# Altium project STM32_Dev_Board.PrjPcb
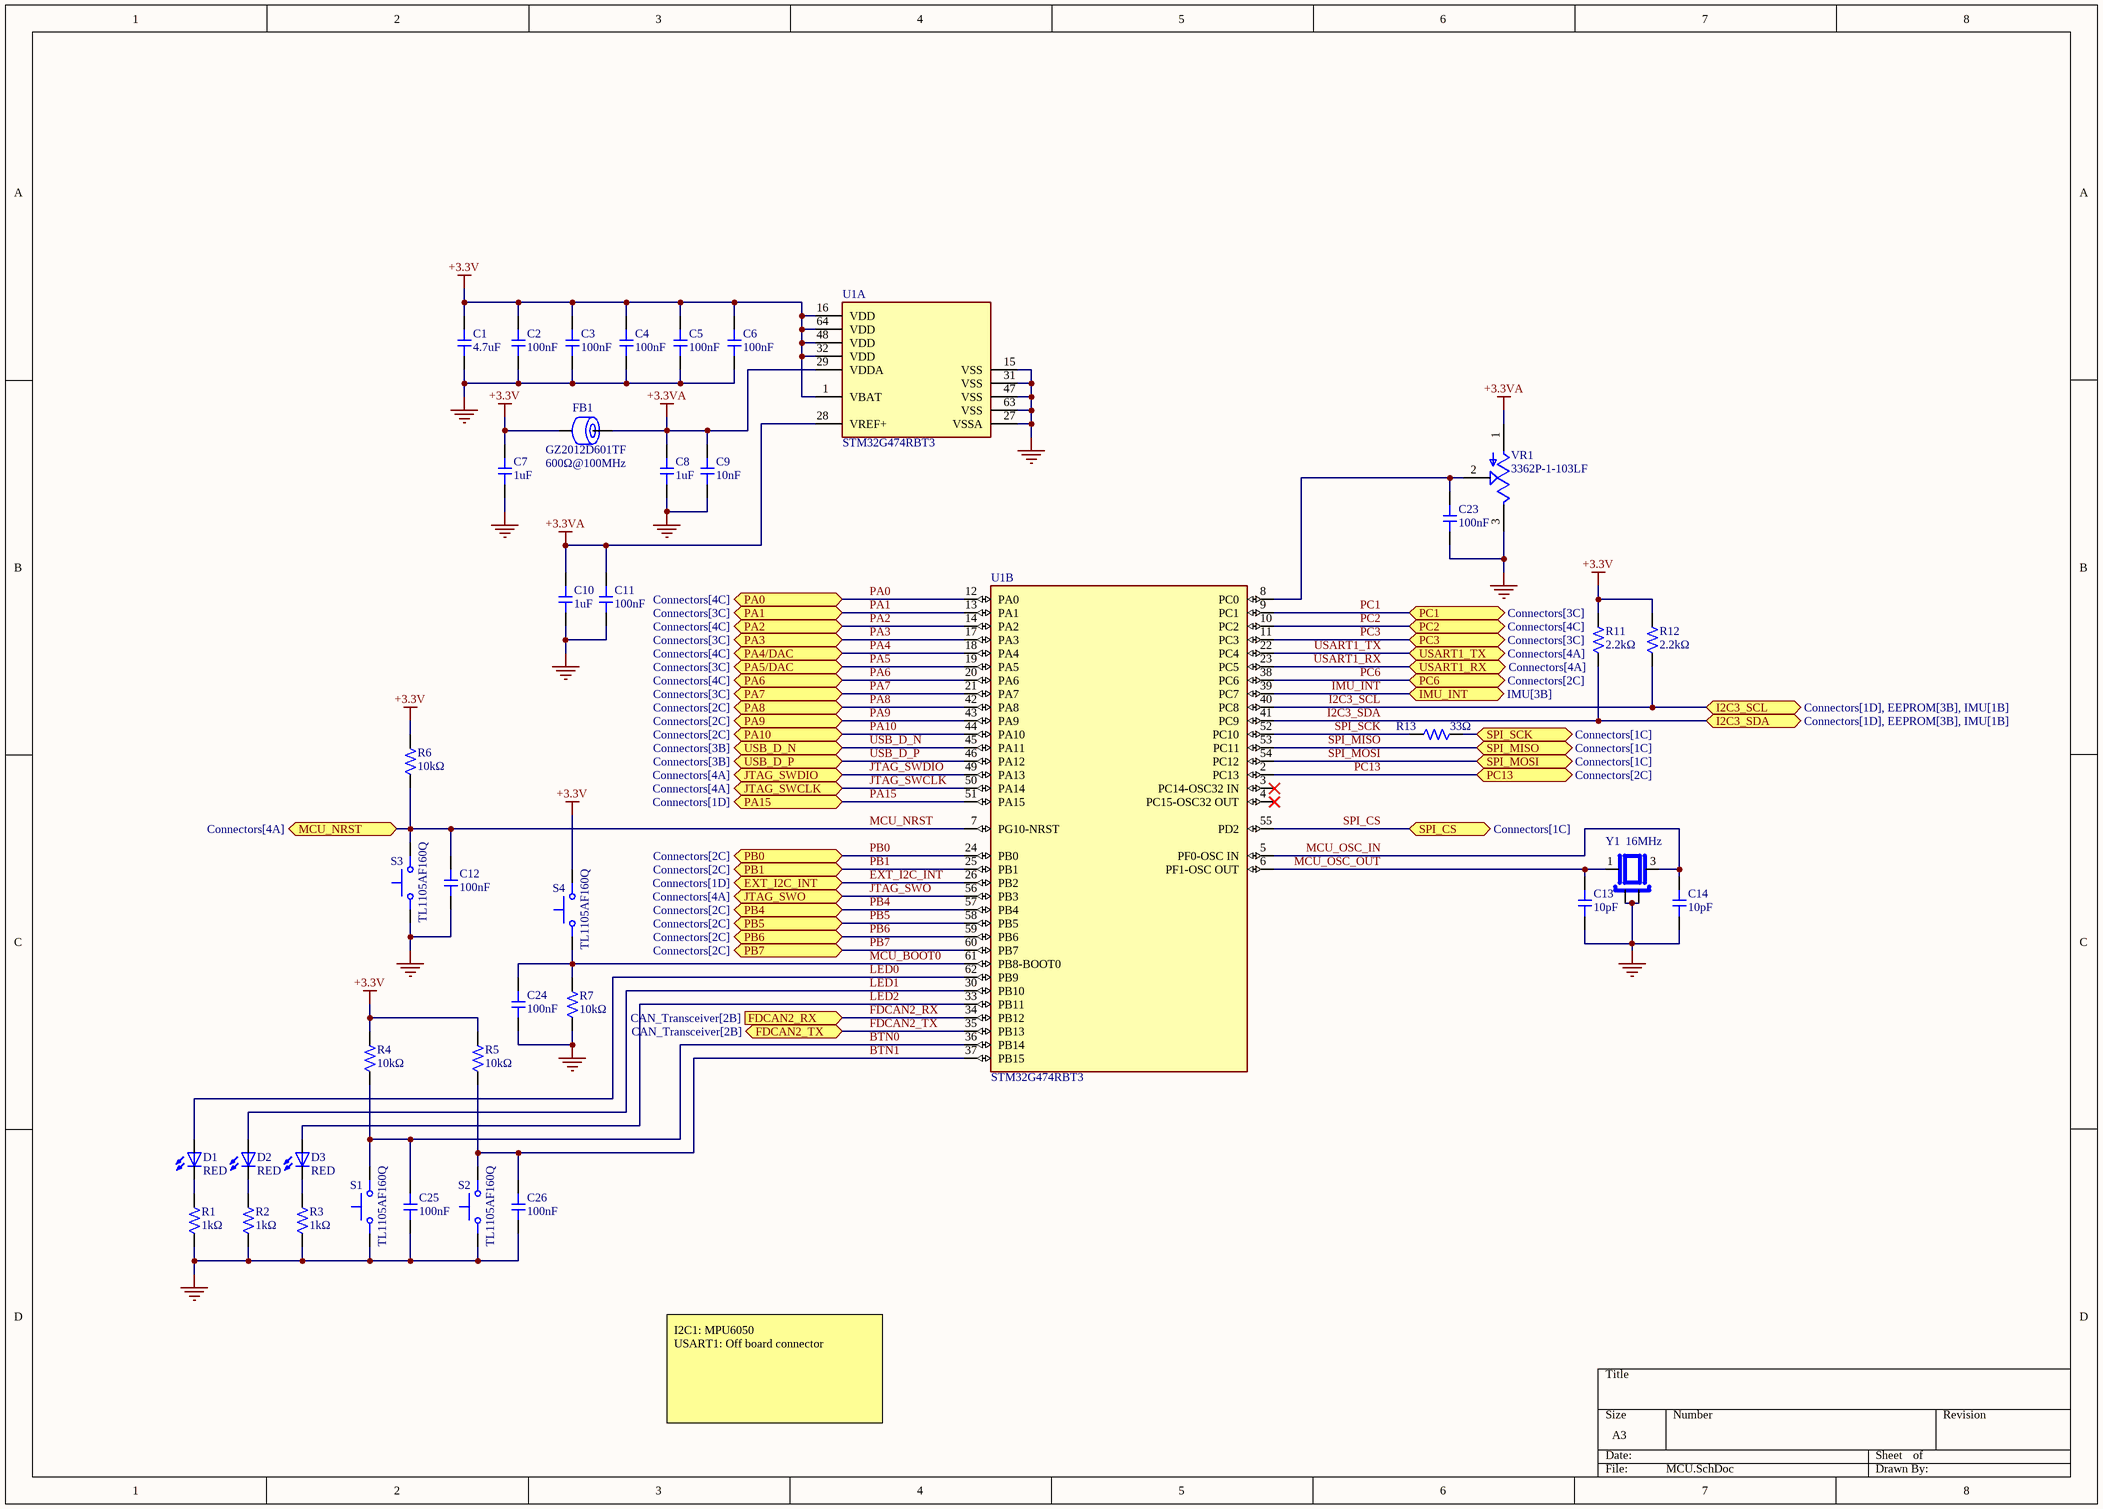
[diagram p0: MCU.SchDoc]
6 sheets, 70 parts. Net scope: flat (ports and power ports of the same name join across sheets).
Board file: STM32_Dev_Board.PcbDoc
Sheets:
  MCU.SchDoc
  Power.SchDoc
  Connectors.SchDoc
  IMU.SchDoc
  CAN_Transceiver.SchDoc
  EEPROM.SchDoc

## Sheet MCU.SchDoc
size A3; SheetNumber: 1; SheetTotal: 6

### Parts
C1  Capacitance: 4.7uF  [CAP-0402]  (hidden comment: CL05A475MP5NRNC)
C2  Capacitance: 100nF  [CAP-0402]  (hidden comment: CL05B104KO5NNNC)
C3  Capacitance: 100nF  [CAP-0402]  (hidden comment: CL05B104KO5NNNC)
C4  Capacitance: 100nF  [CAP-0402]  (hidden comment: CL05B104KO5NNNC)
C5  Capacitance: 100nF  [CAP-0402]  (hidden comment: CL05B104KO5NNNC)
C6  Capacitance: 100nF  [CAP-0402]  (hidden comment: CL05B104KO5NNNC)
C7  Capacitance: 1uF  [CAP-0402]  (hidden comment: CL05A105KA5NQNC)
C8  Capacitance: 1uF  [CAP-0402]  (hidden comment: CL05A105KA5NQNC)
C9  Capacitance: 10nF  [CAP-0402]  (hidden comment: CL05B103KB5NNNC)
C10  Capacitance: 1uF  [CAP-0402]  (hidden comment: CL05A105KA5NQNC)
C11  Capacitance: 100nF  [CAP-0402]  (hidden comment: CL05B104KO5NNNC)
C12  Capacitance: 100nF  [CAP-0402]  (hidden comment: CL05B104KO5NNNC)
C13  Capacitance: 10pF  [CAP-0402]  (hidden comment: CL05C100JB5NNNC)
C14  Capacitance: 10pF  [CAP-0402]  (hidden comment: CL05C100JB5NNNC)
C23  Capacitance: 100nF  [CAP-0402]  (hidden comment: CL05B104KO5NNNC)
C24  Capacitance: 100nF  [CAP-0402]  (hidden comment: CL05B104KO5NNNC)
C25  Capacitance: 100nF  [CAP-0402]  (hidden comment: CL05B104KO5NNNC)
C26  Capacitance: 100nF  [CAP-0402]  (hidden comment: CL05B104KO5NNNC)
D1  RED  [LED-0402]
D2  RED  [LED-0402]
D3  RED  [LED-0402]
FB1  GZ2012D601TF  Impedance @ Frequency: 600Ω@100MHz  [FB-0805]
R1  Resistance: 1kΩ  [RES-0402]  (hidden comment: 0402WGF1001TCE)
R2  Resistance: 1kΩ  [RES-0402]  (hidden comment: 0402WGF1001TCE)
R3  Resistance: 1kΩ  [RES-0402]  (hidden comment: 0402WGF1001TCE)
R4  Resistance: 10kΩ  [RES-0402]  (hidden comment: 0402WGF1002TCE)
R5  Resistance: 10kΩ  [RES-0402]  (hidden comment: 0402WGF1002TCE)
R6  Resistance: 10kΩ  [RES-0402]  (hidden comment: 0402WGF1002TCE)
R7  Resistance: 10kΩ  [RES-0402]  (hidden comment: 0402WGF1002TCE)
R11  Resistance: 2.2kΩ  [RES-0402]  (hidden comment: 0402WGF2201TCE)
R12  Resistance: 2.2kΩ  [RES-0402]  (hidden comment: 0402WGF2201TCE)
R13  Resistance: 33Ω  [RES-0402]  (hidden comment: 0402WGF330JTCE)
S1  TL1105AF160Q  [TL1105AF160Q]
S2  TL1105AF160Q  [TL1105AF160Q]
S3  TL1105AF160Q  [TL1105AF160Q]
S4  TL1105AF160Q  [TL1105AF160Q]
U1  STM32G474RBT3  [FP-LQFP64-5W-MFG]  (parts A,B of 2)
VR1  3362P-1-103LF  [TRIM_3362P-1-103LF]
Y1  16MHz  [OSC_X322516MLB4SI]

### Ports
EXT_I2C_INT (bidir, see Connectors[1D]), FDCAN2_RX (in, see CAN_Transceiver[2B]), FDCAN2_TX (bidir, see CAN_Transceiver[2B]), I2C3_SCL (bidir, see Connectors[1D], EEPROM[3B], IMU[1B]), I2C3_SDA (bidir, see Connectors[1D], EEPROM[3B], IMU[1B]), IMU_INT (bidir, see IMU[3B]), JTAG_SWCLK (bidir, see Connectors[4A]), JTAG_SWDIO (bidir, see Connectors[4A]), JTAG_SWO (bidir, see Connectors[4A]), MCU_NRST (bidir, see Connectors[4A]), PA0 (bidir, see Connectors[4C]), PA1 (bidir, see Connectors[3C]), PA2 (bidir, see Connectors[4C]), PA3 (bidir, see Connectors[3C]), PA4/DAC (bidir, see Connectors[4C]), PA5/DAC (bidir, see Connectors[3C]), PA6 (bidir, see Connectors[4C]), PA7 (bidir, see Connectors[3C]), PA8 (bidir, see Connectors[2C]), PA9 (bidir, see Connectors[2C]), PA10 (bidir, see Connectors[2C]), PA15 (bidir, see Connectors[1D]), PB0 (bidir, see Connectors[2C]), PB1 (bidir, see Connectors[2C]), PB4 (bidir, see Connectors[2C]), PB5 (bidir, see Connectors[2C]), PB6 (bidir, see Connectors[2C]), PB7 (bidir, see Connectors[2C]), PC1 (bidir, see Connectors[3C]), PC2 (bidir, see Connectors[4C]), PC3 (bidir, see Connectors[3C]), PC6 (bidir, see Connectors[2C]), PC13 (bidir, see Connectors[2C]), SPI_CS (bidir, see Connectors[1C]), SPI_MISO (bidir, see Connectors[1C]), SPI_MOSI (bidir, see Connectors[1C]), SPI_SCK (bidir, see Connectors[1C]), USART1_RX (bidir, see Connectors[4A]), USART1_TX (bidir, see Connectors[4A]), USB_D_N (bidir, see Connectors[3B]), USB_D_P (bidir, see Connectors[3B])

### Nets
+3.3V: C1.2 C2.2 C3.2 C4.2 C5.2 C6.2 C7.2 FB1.1 R4.2 R5.2 R6.2 R11.2 R12.2 S4.3 U1.1(VBAT) U1.16(VDD) U1.32(VDD) U1.48(VDD) U1.64(VDD)
+3.3VA: C8.2 C9.2 C10.2 C11.2 FB1.2 U1.28(VREF+) U1.29(VDDA) VR1.1(CCW)
GND: C1.1 C2.1 C3.1 C4.1 C5.1 C6.1 C7.1 C8.1 C9.1 C10.1 C11.1 C12.1 C13.1 C14.1 C23.1 C24.1 C25.1 C26.1 R1.1 R2.1 R3.1 R7.1 S1.1 S2.1 S3.1 U1.15(VSS) U1.27(VSSA) U1.31(VSS) U1.47(VSS) U1.63(VSS) VR1.3(CW) Y1.2(GND) Y1.4(GND)
BTN0: C25.2 R4.1 S1.3 U1.36(PB14)
BTN1: C26.2 R5.1 S2.3 U1.37(PB15)
EXT_I2C_INT: U1.26(PB2) ; port EXT_I2C_INT
FDCAN2_RX: U1.34(PB12) ; port FDCAN2_RX
FDCAN2_TX: U1.35(PB13) ; port FDCAN2_TX
I2C3_SCL: R12.1 U1.40(PC8) ; port I2C3_SCL
I2C3_SDA: R11.1 U1.41(PC9) ; port I2C3_SDA
IMU_INT: U1.39(PC7) ; port IMU_INT
JTAG_SWCLK: U1.50(PA14) ; port JTAG_SWCLK
JTAG_SWDIO: U1.49(PA13) ; port JTAG_SWDIO
JTAG_SWO: U1.56(PB3) ; port JTAG_SWO
LED0: D1.2(POS) U1.62(PB9)
LED1: D2.2(POS) U1.30(PB10)
LED2: D3.2(POS) U1.33(PB11)
MCU_BOOT0: C24.2 R7.2 S4.1 U1.61(PB8-BOOT0)
MCU_NRST: C12.2 R6.1 S3.3 U1.7(PG10-NRST) ; port MCU_NRST
MCU_OSC_IN: C14.2 U1.5(PF0-OSC_IN) Y1.3
MCU_OSC_OUT: C13.2 U1.6(PF1-OSC_OUT) Y1.1
PA0: U1.12(PA0) ; port PA0
PA1: U1.13(PA1) ; port PA1
PA2: U1.14(PA2) ; port PA2
PA3: U1.17(PA3) ; port PA3
PA4: U1.18(PA4) ; port PA4/DAC
PA5: U1.19(PA5) ; port PA5/DAC
PA6: U1.20(PA6) ; port PA6
PA7: U1.21(PA7) ; port PA7
PA8: U1.42(PA8) ; port PA8
PA9: U1.43(PA9) ; port PA9
PA10: U1.44(PA10) ; port PA10
PA15: U1.51(PA15) ; port PA15
PB0: U1.24(PB0) ; port PB0
PB1: U1.25(PB1) ; port PB1
PB4: U1.57(PB4) ; port PB4
PB5: U1.58(PB5) ; port PB5
PB6: U1.59(PB6) ; port PB6
PB7: U1.60(PB7) ; port PB7
PC1: U1.9(PC1) ; port PC1
PC2: U1.10(PC2) ; port PC2
PC3: U1.11(PC3) ; port PC3
PC6: U1.38(PC6) ; port PC6
PC13: U1.2(PC13) ; port PC13
SPI_CS: U1.55(PD2) ; port SPI_CS
SPI_MISO: U1.53(PC11) ; port SPI_MISO
SPI_MOSI: U1.54(PC12) ; port SPI_MOSI
SPI_SCK: R13.1 U1.52(PC10)
USART1_RX: U1.23(PC5) ; port USART1_RX
USART1_TX: U1.22(PC4) ; port USART1_TX
USB_D_N: U1.45(PA11) ; port USB_D_N
USB_D_P: U1.46(PA12) ; port USB_D_P
NetC23_2: C23.2 U1.8(PC0) VR1.2(WIPER)
NetD1_1: D1.1(NEG) R1.2
NetD2_1: D2.1(NEG) R2.2
NetD3_1: D3.1(NEG) R3.2
NetJ8_3: R13.2 ; port SPI_SCK

Not connected (* = marked no-connect by the designer): U1 3(PC14-OSC32_IN)* 4(PC15-OSC32_OUT)*

### Notes on the sheet
- I2C1: MPU6050
  USART1: Off board connector

### Library data of the parts
C1 = CL05A475MP5NRNC: Capacitor, Ceramic (MLCC), 4.7uF, ±20%, 10V, X5R, ±20%, SMD 0402; Manufacturer: Samsung Electro-Mechanics; Temperature Rating: -55°C ~ 85°C; Capacitance @ 1V DC Bias: 4.048uF; Capacitance @ 1.2V DC Bias: 3.816uF; Capacitance @ 1.35V DC Bias: 3.633uF; Capacitance @ 1.5V DC Bias: 3.450uF; Capacitance @ 1.8V DC Bias: 3.100uF; Capacitance @ 2.5V DC Bias: 2.453uF; Capacitance @ 3.3V DC Bias: 1.872uF; Capacitance @ 3.7V DC Bias: 1.663uF; Capacitance @ 4.2V DC Bias: 1.455uF; Capacitance @ 5V DC Bias: 1.191uF; Capacitance @ 9V DC Bias: 0.548uF; Impedance (0V Bias) @ 100Hz: 442Ω; Impedance (0V Bias) @ 500Hz: 90.2Ω; Impedance (0V Bias) @ 1kHz: 45.6Ω; Impedance (0V Bias) @ 5kHz: 9.34Ω; Impedance (0V Bias) @ 10kHz: 4.72Ω; Impedance (0V Bias) @ 50kHz: 0.964Ω; Impedance (0V Bias) @ 100kHz: 0.486Ω; Impedance (0V Bias) @ 500kHz: 0.0987Ω; Impedance (0V Bias) @ 1MHz: 0.0479Ω; Impedance (0V Bias) @ 5MHz: 0.00709Ω; Impedance (0V Bias) @ 10MHz: 0.0183Ω; Impedance (0V Bias) @ 50MHz: 0.06Ω; Impedance (0V Bias) @ 100MHz: 0.102Ω; Impedance (0V Bias) @ 500MHz: 0.377Ω; Impedance (0V Bias) @ 1GHz: 0.66Ω; Impedance (0V Bias) @ 2GHz: 1.52Ω; Impedance (0V Bias) @ 5GHz: 3.05Ω; Impedance (10V Bias) @ 100Hz: 3.34E+03Ω; Impedance (10V Bias) @ 500Hz: 674Ω; Impedance (10V Bias) @ 1kHz: 338Ω; Impedance (10V Bias) @ 5kHz: 68.2Ω; Impedance (10V Bias) @ 10kHz: 34.2Ω; Impedance (10V Bias) @ 50kHz: 6.88Ω; Impedance (10V Bias) @ 100kHz: 3.45Ω; Impedance (10V Bias) @ 500kHz: 0.693Ω; Impedance (10V Bias) @ 1MHz: 0.344Ω; Impedance (10V Bias) @ 5MHz: 0.0603Ω; Impedance (10V Bias) @ 10MHz: 0.0164Ω; Impedance (10V Bias) @ 50MHz: 0.064Ω; Impedance (10V Bias) @ 100MHz: 0.105Ω; Impedance (10V Bias) @ 500MHz: 0.385Ω; Impedance (10V Bias) @ 1GHz: 0.673Ω; Impedance (10V Bias) @ 5GHz: 3.06Ω; Package Size: 0402; JLCPCB Basic Part: Yes; JLCPCB Part Number: C23733; Supplier 1: LCSC; Category: Capacitors - MLCC; Supplier Part Number 1: C23733; Manufacturer Part Number: CL05A475MP5NRNC; Tolerance: ±20%; Voltage Rating: 10V; Temperature Coefficient: X5R; RoHS: Yes; ComponentLink1Description: Datasheet; ComponentLink1URL: https://wmsc.lcsc.com/wmsc/upload/file/pdf/v2/lcsc/2304140030_Samsung-Electro-Mechanics-CL05A475MP5NRNC_C23733.pdf; ComponentLink2Description: JLCPCB Part URL; ComponentLink2URL: https://jlcpcb.com/partdetail/C23733; ComponentLink3Description: LCSC Part URL; ComponentLink3URL: https://lcsc.com/product-detail/Multilayer-Ceramic-Capacitors-MLCC---SMD-SMT_Samsung-Electro-Mechanics-Samsung-Electro-Mechanics-CL05A475MP5NRNC_C23733.html; ComponentLink4Description: Samsung Component Library; ComponentLink4URL: https://weblib.samsungsem.com/mlcc/mlcc-ec.do?partNumber=CL05A475MP5NRN; Impedance (10V Bias) @ 2GHz: 1.52Ω
C2-C6 C11 C12 C23-C26 = CL05B104KO5NNNC: Capacitor, Ceramic (MLCC), 100nF, ±10%, 16V, X7R, ±10%, SMD 0402; Manufacturer: Samsung Electro-Mechanics; Temperature Rating: -55°C ~ 125°C; Capacitance @ 1V DC Bias: 104.721nF; Capacitance @ 1.2V DC Bias: 104.598nF; Capacitance @ 1.35V DC Bias: 104.495nF; Capacitance @ 1.5V DC Bias: 104.372nF; Capacitance @ 1.8V DC Bias: 104.042nF; Capacitance @ 2.5V DC Bias: 102.634nF; Capacitance @ 3.3V DC Bias: 100.452nF; Capacitance @ 3.7V DC Bias: 99.160nF; Capacitance @ 4.2V DC Bias: 97.441nF; Capacitance @ 5V DC Bias: 94.577nF; Capacitance @ 9V DC Bias: 78.638nF; Capacitance @ 12V DC Bias: 66.291nF; Capacitance @ 15V DC Bias: 54.779nF; Impedance (0V Bias) @ 100Hz: 1.71E+04Ω; Impedance (0V Bias) @ 500Hz: 3.48E+03Ω; Impedance (0V Bias) @ 1kHz: 1.75E+03Ω; Impedance (0V Bias) @ 5kHz: 356Ω; Impedance (0V Bias) @ 10kHz: 179Ω; Impedance (0V Bias) @ 50kHz: 36.4Ω; Impedance (0V Bias) @ 100kHz: 18.3Ω; Impedance (0V Bias) @ 500kHz: 3.72Ω; Impedance (0V Bias) @ 1MHz: 1.87Ω; Impedance (0V Bias) @ 5MHz: 0.373Ω; Impedance (0V Bias) @ 10MHz: 0.175Ω; Impedance (0V Bias) @ 50MHz: 0.064Ω; Impedance (0V Bias) @ 100MHz: 0.122Ω; Impedance (0V Bias) @ 500MHz: 0.525Ω; Impedance (0V Bias) @ 1GHz: 0.97Ω; Impedance (0V Bias) @ 2GHz: 2.26Ω; Impedance (0V Bias) @ 5GHz: 4.75Ω; Impedance (16V Bias) @ 100Hz: 2.55E+04Ω; Impedance (16V Bias) @ 500Hz: 5.18E+03Ω; Impedance (16V Bias) @ 1kHz: 2.61E+03Ω; Impedance (16V Bias) @ 5kHz: 529Ω; Impedance (16V Bias) @ 10kHz: 266Ω; Impedance (16V Bias) @ 50kHz: 54Ω; Impedance (16V Bias) @ 100kHz: 27.2Ω; Impedance (16V Bias) @ 500kHz: 5.5Ω; Impedance (16V Bias) @ 1MHz: 2.76Ω; Impedance (16V Bias) @ 5MHz: 0.587Ω; Impedance (16V Bias) @ 10MHz: 0.277Ω; Impedance (16V Bias) @ 50MHz: 0.0412Ω; Impedance (16V Bias) @ 100MHz: 0.133Ω; Impedance (16V Bias) @ 500MHz: 0.524Ω; Impedance (16V Bias) @ 1GHz: 0.969Ω; Impedance (16V Bias) @ 2GHz: 2.25Ω; Impedance (16V Bias) @ 5GHz: 4.7Ω; Package Size: 0402; JLCPCB Basic Part: Yes; JLCPCB Part Number: C1525; Supplier 1: LCSC; Category: Capacitors - MLCC; Supplier Part Number 1: C1525; Manufacturer Part Number: CL05B104KO5NNNC; Tolerance: ±10%; Voltage Rating: 16V; Temperature Coefficient: X7R; RoHS: Yes; ComponentLink1Description: Datasheet; ComponentLink1URL: https://wmsc.lcsc.com/wmsc/upload/file/pdf/v2/lcsc/2304140030_Samsung-Electro-Mechanics-CL05B104KO5NNNC_C1525.pdf; ComponentLink2Description: JLCPCB Part URL; ComponentLink2URL: https://jlcpcb.com/partdetail/C1525; ComponentLink3Description: LCSC Part URL; ComponentLink3URL: https://lcsc.com/product-detail/Multilayer-Ceramic-Capacitors-MLCC---SMD-SMT_Samsung-Electro-Mechanics-Samsung-Electro-Mechanics-CL05B104KO5NNNC_C1525.html; ComponentLink4Description: Samsung Component Library; ComponentLink4URL: https://weblib.samsungsem.com/mlcc/mlcc-ec.do?partNumber=CL05B104KO5NNN
C7 C8 C10 = CL05A105KA5NQNC: Capacitor, Ceramic (MLCC), 1uF, ±10%, 25V, X5R, ±10%, SMD 0402; Manufacturer: Samsung Electro-Mechanics; Temperature Rating: -55°C ~ 85°C; Capacitance @ 1V DC Bias: 1.014uF; Capacitance @ 1.2V DC Bias: 0.983uF; Capacitance @ 1.35V DC Bias: 0.958uF; Capacitance @ 1.5V DC Bias: 0.932uF; Capacitance @ 1.8V DC Bias: 0.879uF; Capacitance @ 2.5V DC Bias: 0.755uF; Capacitance @ 3.3V DC Bias: 0.618uF; Capacitance @ 3.7V DC Bias: 0.562uF; Capacitance @ 4.2V DC Bias: 0.501uF; Capacitance @ 5V DC Bias: 0.420uF; Capacitance @ 9V DC Bias: 0.204uF; Capacitance @ 12V DC Bias: 0.147uF; Capacitance @ 15V DC Bias: 0.107uF; Capacitance @ 24V DC Bias: 0.061uF; Impedance (0V Bias) @ 100Hz: 1.95E+03Ω; Impedance (0V Bias) @ 500Hz: 402Ω; Impedance (0V Bias) @ 1kHz: 204Ω; Impedance (0V Bias) @ 5kHz: 42Ω; Impedance (0V Bias) @ 10kHz: 21.3Ω; Impedance (0V Bias) @ 50kHz: 4.4Ω; Impedance (0V Bias) @ 100kHz: 2.23Ω; Impedance (0V Bias) @ 500kHz: 0.462Ω; Impedance (0V Bias) @ 1MHz: 0.234Ω; Impedance (0V Bias) @ 5MHz: 0.0392Ω; Impedance (0V Bias) @ 10MHz: 0.0118Ω; Impedance (0V Bias) @ 50MHz: 0.0671Ω; Impedance (0V Bias) @ 100MHz: 0.118Ω; Impedance (0V Bias) @ 500MHz: 0.452Ω; Impedance (0V Bias) @ 1GHz: 0.812Ω; Impedance (0V Bias) @ 2GHz: 1.8Ω; Impedance (0V Bias) @ 5GHz: 3.57Ω; Impedance (25V Bias) @ 100Hz: 2.62E+04Ω; Impedance (25V Bias) @ 500Hz: 5.28E+03Ω; Impedance (25V Bias) @ 1kHz: 2.65E+03Ω; Impedance (25V Bias) @ 5kHz: 533Ω; Impedance (25V Bias) @ 10kHz: 267Ω; Impedance (25V Bias) @ 50kHz: 53.8Ω; Impedance (25V Bias) @ 100kHz: 27Ω; Impedance (25V Bias) @ 500kHz: 5.42Ω; Impedance (25V Bias) @ 1MHz: 2.7Ω; Impedance (25V Bias) @ 5MHz: 0.621Ω; Impedance (25V Bias) @ 10MHz: 0.298Ω; Impedance (25V Bias) @ 50MHz: 0.0523Ω; Impedance (25V Bias) @ 100MHz: 0.113Ω; Impedance (25V Bias) @ 500MHz: 0.451Ω; Impedance (25V Bias) @ 1GHz: 0.82Ω; Impedance (25V Bias) @ 2GHz: 1.85Ω; Impedance (25V Bias) @ 5GHz: 3.51Ω; Package Size: 0402; JLCPCB Basic Part: Yes; JLCPCB Part Number: C52923; Supplier 1: LCSC; Category: Capacitors - MLCC; Supplier Part Number 1: C52923; Manufacturer Part Number: CL05A105KA5NQNC; Tolerance: ±10%; Voltage Rating: 25V; Temperature Coefficient: X5R; RoHS: Yes; ComponentLink1Description: Datasheet; ComponentLink1URL: https://wmsc.lcsc.com/wmsc/upload/file/pdf/v2/lcsc/2304140030_Samsung-Electro-Mechanics-CL05A105KA5NQNC_C52923.pdf; ComponentLink2Description: JLCPCB Part URL; ComponentLink2URL: https://jlcpcb.com/partdetail/C52923; ComponentLink3Description: LCSC Part URL; ComponentLink3URL: https://lcsc.com/product-detail/Multilayer-Ceramic-Capacitors-MLCC---SMD-SMT_Samsung-Electro-Mechanics-Samsung-Electro-Mechanics-CL05A105KA5NQNC_C52923.html; ComponentLink4Description: Samsung Component Library; ComponentLink4URL: https://weblib.samsungsem.com/mlcc/mlcc-ec.do?partNumber=CL05A105KA5NQN
C9 = CL05B103KB5NNNC: Capacitor, Ceramic (MLCC), 10nF, ±10%, 50V, X7R, ±10%, SMD 0402; Manufacturer: Samsung Electro-Mechanics; Temperature Rating: -55°C ~ 125°C; Capacitance @ 1V DC Bias: 10.426nF; Capacitance @ 1.2V DC Bias: 10.434nF; Capacitance @ 1.35V DC Bias: 10.444nF; Capacitance @ 1.5V DC Bias: 10.455nF; Capacitance @ 1.8V DC Bias: 10.480nF; Capacitance @ 2.5V DC Bias: 10.514nF; Capacitance @ 3.3V DC Bias: 10.519nF; Capacitance @ 3.7V DC Bias: 10.504nF; Capacitance @ 4.2V DC Bias: 10.473nF; Capacitance @ 5V DC Bias: 10.402nF; Capacitance @ 9V DC Bias: 10.052nF; Capacitance @ 12V DC Bias: 9.639nF; Capacitance @ 15V DC Bias: 9.187nF; Capacitance @ 24V DC Bias: 7.606nF; Capacitance @ 36V DC Bias: 5.499nF; Capacitance @ 48V DC Bias: 3.591nF; Impedance (0V Bias) @ 100Hz: 1.57E+05Ω; Impedance (0V Bias) @ 500Hz: 3.19E+04Ω; Impedance (0V Bias) @ 1kHz: 1.61E+04Ω; Impedance (0V Bias) @ 5kHz: 3.27E+03Ω; Impedance (0V Bias) @ 10kHz: 1.65E+03Ω; Impedance (0V Bias) @ 50kHz: 335Ω; Impedance (0V Bias) @ 100kHz: 169Ω; Impedance (0V Bias) @ 500kHz: 34.3Ω; Impedance (0V Bias) @ 1MHz: 17.3Ω; Impedance (0V Bias) @ 5MHz: 3.52Ω; Impedance (0V Bias) @ 10MHz: 1.77Ω; Impedance (0V Bias) @ 50MHz: 0.285Ω; Impedance (0V Bias) @ 100MHz: 0.0835Ω; Impedance (0V Bias) @ 500MHz: 0.751Ω; Impedance (0V Bias) @ 1GHz: 1.42Ω; Impedance (0V Bias) @ 2GHz: 3.22Ω; Impedance (0V Bias) @ 5GHz: 6.48Ω; Package Size: 0402; JLCPCB Basic Part: Yes; JLCPCB Part Number: C15195; Supplier 1: LCSC; Category: Capacitors - MLCC; Supplier Part Number 1: C15195; Manufacturer Part Number: CL05B103KB5NNNC; Tolerance: ±10%; Voltage Rating: 50V; Temperature Coefficient: X7R; RoHS: Yes; ComponentLink1Description: Datasheet; ComponentLink1URL: https://wmsc.lcsc.com/wmsc/upload/file/pdf/v2/lcsc/2304140030_Samsung-Electro-Mechanics-CL05B103KB5NNNC_C15195.pdf; ComponentLink2Description: JLCPCB Part URL; ComponentLink2URL: https://jlcpcb.com/partdetail/C15195; ComponentLink3Description: LCSC Part URL; ComponentLink3URL: https://lcsc.com/product-detail/Multilayer-Ceramic-Capacitors-MLCC---SMD-SMT_Samsung-Electro-Mechanics-Samsung-Electro-Mechanics-CL05B103KB5NNNC_C15195.html; ComponentLink4Description: Samsung Component Library; ComponentLink4URL: https://weblib.samsungsem.com/mlcc/mlcc-ec.do?partNumber=CL05B103KB5NNN
C13 C14 = CL05C100JB5NNNC: Capacitor, Ceramic (MLCC), 10pF, ±5%, 50V, C0G, ±5%, SMD 0402; Manufacturer: Samsung Electro-Mechanics; Temperature Rating: -55°C ~ 125°C; Impedance (0V Bias) @ 100MHz: 159Ω; Impedance (0V Bias) @ 500MHz: 31Ω; Impedance (0V Bias) @ 1GHz: 14.2Ω; Impedance (0V Bias) @ 2GHz: 2.29Ω; Impedance (0V Bias) @ 5GHz: 4.97Ω; Package Size: 0402; JLCPCB Basic Part: Yes; JLCPCB Part Number: C32949; Supplier 1: LCSC; Category: Capacitors - MLCC; Supplier Part Number 1: C32949; Manufacturer Part Number: CL05C100JB5NNNC; Tolerance: ±5%; Voltage Rating: 50V; Temperature Coefficient: C0G; RoHS: Yes; ComponentLink1Description: Datasheet; ComponentLink1URL: https://wmsc.lcsc.com/wmsc/upload/file/pdf/v2/lcsc/2304140030_Samsung-Electro-Mechanics-CL05C100JB5NNNC_C32949.pdf; ComponentLink2Description: JLCPCB Part URL; ComponentLink2URL: https://jlcpcb.com/partdetail/C32949; ComponentLink3Description: LCSC Part URL; ComponentLink3URL: https://lcsc.com/product-detail/Multilayer-Ceramic-Capacitors-MLCC---SMD-SMT_Samsung-Electro-Mechanics-Samsung-Electro-Mechanics-CL05C100JB5NNNC_C32949.html; ComponentLink4Description: Samsung Component Library; ComponentLink4URL: https://weblib.samsungsem.com/mlcc/mlcc-ec.do?partNumber=CL05C100JB5NNN
D1-D3 = 16-213SDRC/S530-A3/TR8: -40℃~+85℃ 120° 20mA 2V 43mcd 639nm 650nm Red Water Clear 0402 LED Indication - Discrete ROHS; MF: WÃ¼rth Elektronik; MP: 150040GS73220; Package: 0402; Price: None; Value: *; SnapEDA_Link: https://www.snapeda.com/parts/150040GS73220/W%25C3%25BCrth+Elektronik+Midcom/view-part/?ref=snap; Availability: Unavailable; Check_prices: https://www.snapeda.com/parts/150040GS73220/W%25C3%25BCrth+Elektronik+Midcom/view-part/?ref=eda
FB1 = GZ2012D601TF: Ferrite, 600Ω@100MHz, ±25%, 300mΩ, 500mA, SMD 0805; Manufacturer: Sunlord; Package Size: 0805; JLCPCB Basic Part: Yes; JLCPCB Part Number: C1017; Supplier 1: LCSC; Category: Ferrite Beads; Supplier Part Number 1: C1017; Manufacturer Part Number: GZ2012D601TF; Tolerance: ±25%; Rated Current: 500mA; DC Resistance: 300mΩ; RoHS: Yes; ComponentLink1Description: Datasheet; ComponentLink1URL: https://wmsc.lcsc.com/wmsc/upload/file/pdf/v2/lcsc/2310301640_Sunlord-GZ2012D601TF_C1017.pdf; ComponentLink2Description: JLCPCB Part URL; ComponentLink2URL: https://jlcpcb.com/partdetail/C1017; ComponentLink3Description: LCSC Part URL; ComponentLink3URL: https://lcsc.com/product-detail/Ferrite-Beads_Sunlord-Sunlord-GZ2012D601TF_C1017.html
R1-R3 = 0402WGF1001TCE: Resistor, 1kΩ, ±1%, 62.5mW, 50V, ±100ppm/℃, -55℃~+155℃, SMD 0402; Manufacturer: Uniroyal; Supplier 1: LCSC; Manufacturer Part Number: 0402WGF1001TCE; Supplier Part Number 1: C11702; JLCPCB Part Number: C11702; Power Rating: 62.5mW; Category: Resistors; Package Size: 0402; JLCPCB Basic Part: Yes; Tolerance: ±1%; Voltage Rating: 50V; Temperature Coefficient: ±100ppm/℃; Temperature Rating: -55℃~+155℃; ComponentLink1Description: Datasheet; ComponentLink1URL: https://wmsc.lcsc.com/wmsc/upload/file/pdf/v2/lcsc/2206010216_UNI-ROYAL-Uniroyal-Elec-0402WGF1001TCE_C11702.pdf; ComponentLink2Description: JLCPCB Part URL; ComponentLink2URL: https://jlcpcb.com/partdetail/C11702
R4-R7 = 0402WGF1002TCE: Resistor, 10kΩ, ±1%, 62.5mW, 50V, ±100ppm/℃, -55℃~+155℃, SMD 0402; Manufacturer: Uniroyal; Supplier 1: LCSC; Manufacturer Part Number: 0402WGF1002TCE; Supplier Part Number 1: C25744; JLCPCB Part Number: C25744; Power Rating: 62.5mW; Category: Resistors; Package Size: 0402; JLCPCB Basic Part: Yes; Tolerance: ±1%; Voltage Rating: 50V; Temperature Coefficient: ±100ppm/℃; Temperature Rating: -55℃~+155℃; ComponentLink1Description: Datasheet; ComponentLink1URL: https://wmsc.lcsc.com/wmsc/upload/file/pdf/v2/lcsc/2206010100_UNI-ROYAL-Uniroyal-Elec-0402WGF1002TCE_C25744.pdf; ComponentLink2Description: JLCPCB Part URL; ComponentLink2URL: https://jlcpcb.com/partdetail/C25744
R11 R12 = 0402WGF2201TCE: Resistor, 2.2kΩ, ±1%, 62.5mW, 50V, ±100ppm/℃, -55℃~+155℃, SMD 0402; Manufacturer: Uniroyal; Supplier 1: LCSC; Manufacturer Part Number: 0402WGF2201TCE; Supplier Part Number 1: C25879; JLCPCB Part Number: C25879; Power Rating: 62.5mW; Category: Resistors; Package Size: 0402; JLCPCB Basic Part: Yes; Tolerance: ±1%; Voltage Rating: 50V; Temperature Coefficient: ±100ppm/℃; Temperature Rating: -55℃~+155℃; ComponentLink1Description: Datasheet; ComponentLink1URL: https://wmsc.lcsc.com/wmsc/upload/file/pdf/v2/lcsc/2206010045_UNI-ROYAL-Uniroyal-Elec-0402WGF2201TCE_C25879.pdf; ComponentLink2Description: JLCPCB Part URL; ComponentLink2URL: https://jlcpcb.com/partdetail/C25879
R13 = 0402WGF330JTCE: Resistor, 33Ω, ±1%, 62.5mW, 50V, ±100ppm/℃, -55℃~+155℃, SMD 0402; Manufacturer: Uniroyal; Supplier 1: LCSC; Manufacturer Part Number: 0402WGF330JTCE; Supplier Part Number 1: C25105; JLCPCB Part Number: C25105; Power Rating: 62.5mW; Category: Resistors; Package Size: 0402; JLCPCB Basic Part: Yes; Tolerance: ±1%; Voltage Rating: 50V; Temperature Coefficient: ±100ppm/℃; Temperature Rating: -55℃~+155℃; ComponentLink1Description: Datasheet; ComponentLink1URL: https://wmsc.lcsc.com/wmsc/upload/file/pdf/v2/lcsc/2205311900_UNI-ROYAL-Uniroyal-Elec-0402WGF330JTCE_C25105.pdf; ComponentLink2Description: JLCPCB Part URL; ComponentLink2URL: https://jlcpcb.com/partdetail/C25105
S1-S4 = TL1105AF160Q: Tactile Switch SPST-NO Top Actuated Through Hole; MF: E-Switch; SnapEDA_Link: https://www.snapeda.com/parts/TL1105AF160Q/E-Switch/view-part/?ref=snap; Package: None; Value: *; MP: TL1105AF160Q; Check_prices: https://www.snapeda.com/parts/TL1105AF160Q/E-Switch/view-part/?ref=eda
U1 = CMP-12105-000044-1: MAINSTREAM ARM CORTEX-M4 CORE WI; Manufacturer: STMicroelectronics; Ram Size: 128KBytes; Number Of Cores: 1; Number Of I2C Channels: 4; Data Bus Width: 32bits; Max Supply Voltage: 3.6V; Memory Type: FLASH; Number Of I/Os: 52; Number Of Spi Channels: 3; Memory Size: 512KBytes; Number Of Pwm Channels: 13; Max Junction Temp: +130°C; Number Of Adc Channels: 26; Number Of Timers/Counters: 14; Frequency: 170MHz; Interface: I2C,SPI,UART,USART,CAN,USB,LIN,IrDA,I2S,SMBus,Other; Standoff Height: 0.05mm; Number Of Uart Channels: 6; Min Supply Voltage: 1.62V; Device Class L3: Microcontrollers; Ambient Temperature Range Low: -40°C; Device Class L2: Embedded Processors and Controllers; Manufacturer Part Number: STM32G474RBT3; Digikey Description: MAINSTREAM ARM CORTEX-M4 CORE WI; Height: 1.6mm; Temperature Range Low: -40°C; RoHS: TRUE; Automotive: No; Lead Free: Yes; Device Class L1: Integrated Circuits (ICs); Package: LQFP64-5W; Octopart: https://octopart.com/stm32g474rbt3-stmicroelectronics-102823552; ComponentLink2URL: https://www.st.com/resource/en/datasheet/stm32g474rb.pdf; Number Of A/D Converters: 1; ComponentLink2Description: Datasheet; Core Architecture: ARM Cortex-M4; Temperature Range High: +125°C; Ambient Temperature Range High: +125°C; Temperature: -40°C to +125°C; Category: IC; Number Of Usb Channels: 1
VR1 = 3362P-1-103LF: Trimmer, Cermet, Rest 10 Kilohms, PCB, 1 Turns, Pwr-Rtg 0.5 W, Tol 10% | Bourns 3362P-1-103LF; SnapEDA_Link: https://www.snapeda.com/parts/3362P-1-103LF/Bourns/view-part/?ref=snap; Package: 3362P-1 Bourns Inc.; Value: *; MF: Bourns; MP: 3362P-1-103LF; Check_prices: https://www.snapeda.com/parts/3362P-1-103LF/Bourns/view-part/?ref=eda
Y1 = X322516MLB4SI: -40℃~+85℃ 16MHz 50Ω 10pF Crystal Oscillator ±10ppm ±20ppm SMD3225-4P Crystals ROHS; MF: YXC; SnapEDA_Link: https://www.snapeda.com/parts/X322516MLB4SI/YXC/view-part/?ref=snap; Package: Package; Value: *; MP: X322516MLB4SI; Check_prices: https://www.snapeda.com/parts/X322516MLB4SI/YXC/view-part/?ref=eda

## Sheet Power.SchDoc
size A4; SheetNumber: 2; SheetTotal: 5
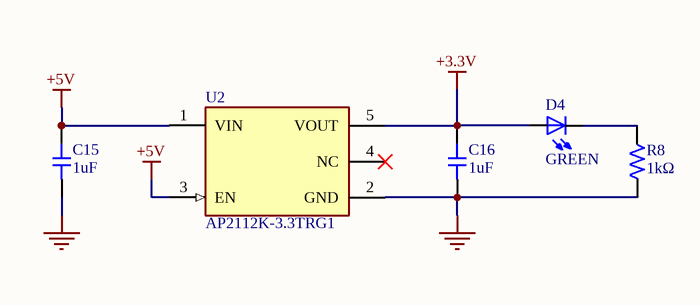
[diagram p1: Power.SchDoc]

### Parts
C15  Capacitance: 1uF  [CAP-0402]  (hidden comment: CL05A105KA5NQNC)
C16  Capacitance: 1uF  [CAP-0402]  (hidden comment: CL05A105KA5NQNC)
D4  GREEN  [LED-0402]
R8  Resistance: 1kΩ  [RES-0402]  (hidden comment: 0402WGF1001TCE)
U2  AP2112K-3.3TRG1  [FP-SOT25-IPC_A]

### Nets
+3.3V: C16.2 D4.2(POS) U2.5(VOUT)
+5V: C15.2 U2.1(VIN) U2.3(EN)
GND: C15.1 C16.1 R8.1 U2.2(GND)
NetD4_1: D4.1(NEG) R8.2

Not connected (* = marked no-connect by the designer): U2 4(NC)*

### Library data of the parts
C15 C16 = CL05A105KA5NQNC: as C7 on sheet MCU; Package Size: 0402; JLCPCB Basic Part: Yes; JLCPCB Part Number: C52923; Supplier 1: LCSC; Category: Capacitors - MLCC; Supplier Part Number 1: C52923; Manufacturer Part Number: CL05A105KA5NQNC; Tolerance: ±10%; Voltage Rating: 25V; Temperature Coefficient: X5R; RoHS: Yes; ComponentLink1Description: Datasheet; ComponentLink1URL: https://wmsc.lcsc.com/wmsc/upload/file/pdf/v2/lcsc/2304140030_Samsung-Electro-Mechanics-CL05A105KA5NQNC_C52923.pdf; ComponentLink2Description: JLCPCB Part URL; ComponentLink2URL: https://jlcpcb.com/partdetail/C52923; ComponentLink3Description: LCSC Part URL; ComponentLink3URL: https://lcsc.com/product-detail/Multilayer-Ceramic-Capacitors-MLCC---SMD-SMT_Samsung-Electro-Mechanics-Samsung-Electro-Mechanics-CL05A105KA5NQNC_C52923.html; ComponentLink4Description: Samsung Component Library; ComponentLink4URL: https://weblib.samsungsem.com/mlcc/mlcc-ec.do?partNumber=CL05A105KA5NQN
D4 = 16-213/GHC-YR1S1/3T: -40℃~+85℃ 1.7V~2.4V 120° 20mA 36mcd~50mcd 60mW 624nm 632nm Discrete Diode Red Water Clear 0402 LED Indication - Discrete ROHS; MF: WÃ¼rth Elektronik; MP: 150040GS73220; Package: 0402; Price: None; Value: *; SnapEDA_Link: https://www.snapeda.com/parts/150040GS73220/W%25C3%25BCrth+Elektronik+Midcom/view-part/?ref=snap; Availability: Unavailable; Check_prices: https://www.snapeda.com/parts/150040GS73220/W%25C3%25BCrth+Elektronik+Midcom/view-part/?ref=eda
R8 = 0402WGF1001TCE: as R1 on sheet MCU; Supplier 1: LCSC; Manufacturer Part Number: 0402WGF1001TCE; Supplier Part Number 1: C11702; JLCPCB Part Number: C11702; Power Rating: 62.5mW; Category: Resistors; Package Size: 0402; JLCPCB Basic Part: Yes; Tolerance: ±1%; Voltage Rating: 50V; Temperature Coefficient: ±100ppm/℃; Temperature Rating: -55℃~+155℃; ComponentLink1Description: Datasheet; ComponentLink1URL: https://wmsc.lcsc.com/wmsc/upload/file/pdf/v2/lcsc/2206010216_UNI-ROYAL-Uniroyal-Elec-0402WGF1001TCE_C11702.pdf; ComponentLink2Description: JLCPCB Part URL; ComponentLink2URL: https://jlcpcb.com/partdetail/C11702
U2 = CMP-12756-000035-1: IC REG LINEAR 3.3V 600MA SOT25; Number of Regulators: 1; Output Type: Fixed; Polarity: Positive; Min Input Voltage: 2.5V; Max Input Voltage: 6V; Accuracy: 1.5%; Quiescent Current: 55uA; Dropout Voltage: 250mV; Min Operating Temperature: -40°C; Length: 3.1mm; Output Current: 600mA; Max Operating Temperature: 85°C; Package Quantity: 1; Output Voltage: 3.3V; Width: 1.7mm; Number of Outputs: 1; Packaging: Tape and Reel; Height: 1.3mm; Lead Free: Lead Free; Max Output Current: 600mA; Case/Package: SOT-23-5; Mount: Surface Mount; Number of Pins: 5

## Sheet Connectors.SchDoc
size A4; SheetNumber: 3; SheetTotal: 6
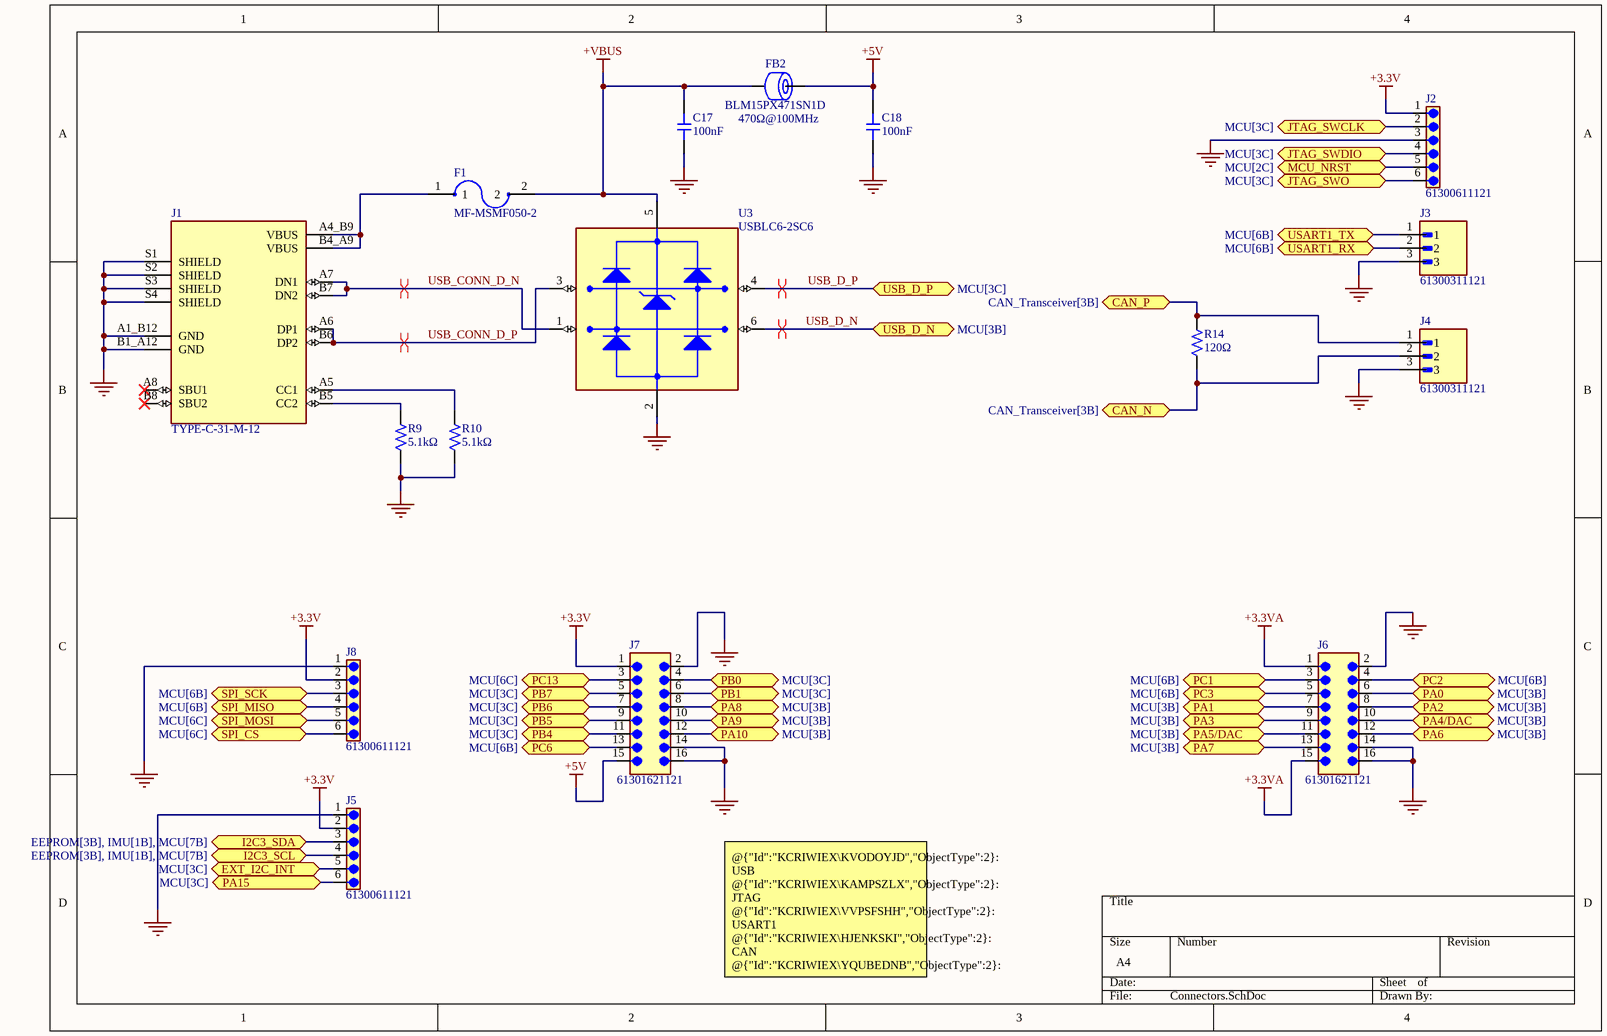
[diagram p2: Connectors.SchDoc]

### Parts
C17  Capacitance: 100nF  [CAP-0402]  (hidden comment: CL05B104KO5NNNC)
C18  Capacitance: 100nF  [CAP-0402]  (hidden comment: CL05B104KO5NNNC)
F1  MF-MSMF050-2  [FUSM4632X85]
FB2  BLM15PX471SN1D  Impedance @ Frequency: 470Ω@100MHz  [FB-0402]
J1  TYPE-C-31-M-12  [HRO_TYPE-C-31-M-12]
J2  61300611121  [61300611121]
J3  61300311121  [WURTH_61300311121]
J4  61300311121  [WURTH_61300311121]
J5  61300611121  [61300611121]
J6  61301621121  [61301621121]
J7  61301621121  [61301621121]
J8  61300611121  [61300611121]
R9  Resistance: 5.1kΩ  [RES-0402]  (hidden comment: 0402WGF5101TCE)
R10  Resistance: 5.1kΩ  [RES-0402]  (hidden comment: 0402WGF5101TCE)
R14  Resistance: 120Ω  [RES-0402]  (hidden comment: 0402WGF1200TCE)
U3  USBLC6-2SC6  [SOT95P280X145-6N]

### Ports
CAN_N (bidir, see CAN_Transceiver[3B]), CAN_P (bidir, see CAN_Transceiver[3B]), EXT_I2C_INT (bidir, see MCU[3C]), I2C3_SCL (bidir, see EEPROM[3B], IMU[1B], MCU[7B]), I2C3_SDA (bidir, see EEPROM[3B], IMU[1B], MCU[7B]), JTAG_SWCLK (bidir, see MCU[3C]), JTAG_SWDIO (bidir, see MCU[3C]), JTAG_SWO (bidir, see MCU[3C]), MCU_NRST (bidir, see MCU[2C]), PA0 (bidir, see MCU[3B]), PA1 (bidir, see MCU[3B]), PA2 (bidir, see MCU[3B]), PA3 (bidir, see MCU[3B]), PA4/DAC (bidir, see MCU[3B]), PA5/DAC (bidir, see MCU[3B]), PA6 (bidir, see MCU[3B]), PA7 (bidir, see MCU[3B]), PA8 (bidir, see MCU[3B]), PA9 (bidir, see MCU[3B]), PA10 (bidir, see MCU[3B]), PA15 (bidir, see MCU[3C]), PB0 (bidir, see MCU[3C]), PB1 (bidir, see MCU[3C]), PB4 (bidir, see MCU[3C]), PB5 (bidir, see MCU[3C]), PB6 (bidir, see MCU[3C]), PB7 (bidir, see MCU[3C]), PC1 (bidir, see MCU[6B]), PC2 (bidir, see MCU[6B]), PC3 (bidir, see MCU[6B]), PC6 (bidir, see MCU[6B]), PC13 (bidir, see MCU[6C]), SPI_CS (bidir, see MCU[6C]), SPI_MISO (bidir, see MCU[6B]), SPI_MOSI (bidir, see MCU[6C]), SPI_SCK (bidir, see MCU[6B]), USART1_RX (bidir, see MCU[6B]), USART1_TX (bidir, see MCU[6B]), USB_D_N (bidir, see MCU[3B]), USB_D_P (bidir, see MCU[3C])

### Nets
+3.3V: J2.1 J5.2 J7.1 J8.2
+3.3VA: J6.1 J6.15
+5V: C18.2 FB2.2 J7.15
+VBUS: C17.2 F1.2 FB2.1 U3.5(VBUS)
GND: C17.1 C18.1 J1.A1_B12(GND) J1.B1_A12(GND) J1.S1(SHIELD) J1.S2(SHIELD) J1.S3(SHIELD) J1.S4(SHIELD) J2.3 J3.3 J4.3 J5.1 J6.2 J6.14 J6.16 J7.2 J7.14 J7.16 J8.1 R9.1 R10.1 U3.2(GND)
CAN_N: J4.2 R14.1 ; port CAN_N
CAN_P: J4.1 R14.2 ; port CAN_P
EXT_I2C_INT: J5.5 ; port EXT_I2C_INT
I2C3_SCL: J5.4 ; port I2C3_SCL
I2C3_SDA: J5.3 ; port I2C3_SDA
JTAG_SWCLK: J2.2 ; port JTAG_SWCLK
JTAG_SWDIO: J2.4 ; port JTAG_SWDIO
JTAG_SWO: J2.6 ; port JTAG_SWO
MCU_NRST: J2.5 ; port MCU_NRST
PA0: J6.6 ; port PA0
PA1: J6.7 ; port PA1
PA2: J6.8 ; port PA2
PA3: J6.9 ; port PA3
PA4: J6.10 ; port PA4/DAC
PA5: J6.11 ; port PA5/DAC
PA6: J6.12 ; port PA6
PA7: J6.13 ; port PA7
PA8: J7.8 ; port PA8
PA9: J7.10 ; port PA9
PA10: J7.12 ; port PA10
PA15: J5.6 ; port PA15
PB0: J7.4 ; port PB0
PB1: J7.6 ; port PB1
PB4: J7.11 ; port PB4
PB5: J7.9 ; port PB5
PB6: J7.7 ; port PB6
PB7: J7.5 ; port PB7
PC1: J6.3 ; port PC1
PC2: J6.4 ; port PC2
PC3: J6.5 ; port PC3
PC6: J7.13 ; port PC6
PC13: J7.3 ; port PC13
SPI_CS: J8.6 ; port SPI_CS
SPI_MISO: J8.4 ; port SPI_MISO
SPI_MOSI: J8.5 ; port SPI_MOSI
USART1_RX: J3.2 ; port USART1_RX
USART1_TX: J3.1 ; port USART1_TX
USB_CONN_D_N: J1.A7(DN1) J1.B7(DN2) U3.1(I/O1_IN)
USB_CONN_D_P: J1.A6(DP1) J1.B6(DP2) U3.3(I/O2_IN)
USB_D_N: U3.6(I/O1_OUT) ; port USB_D_N
USB_D_P: U3.4(I/O2_OUT) ; port USB_D_P
NetF1_1: F1.1 J1.A4_B9(VBUS) J1.B4_A9(VBUS)
NetJ1_A5: J1.A5(CC1) R10.2
NetJ1_B5: J1.B5(CC2) R9.2
NetJ8_3: J8.3 ; port SPI_SCK

Not connected (* = marked no-connect by the designer): J1 A8(SBU1)* B8(SBU2)*

### Layout directives
differential pair; differential pair class DIFF_USB: USB_CONN_D_N, USB_CONN_D_P, USB_D_N, USB_D_P

### Notes on the sheet
- @{"Id":"KCRIWIEX\KVODOYJD","ObjectType":2}: USB
  @{"Id":"KCRIWIEX\KAMPSZLX","ObjectType":2}: JTAG
  @{"Id":"KCRIWIEX\VVPSFSHH","ObjectType":2}: USART1
  @{"Id":"KCRIWIEX\HJENKSKI","ObjectType":2}: CAN
  @{"Id":"KCRIWIEX\YQUBEDNB","ObjectType":2}: I2C3
  @{"Id":"KCRIWIEX\OTQHTWFR","ObjectType":2}: Analog
  @{"Id":"KCRIWIEX\IUIQBGCT","ObjectType":2}: PWM / Timer
  @{"Id":"KCRIWIEX\MERWTRKB","ObjectType":2}: SPI3

### Library data of the parts
C17 C18 = CL05B104KO5NNNC: as C2 on sheet MCU; Package Size: 0402; JLCPCB Basic Part: Yes; JLCPCB Part Number: C1525; Supplier 1: LCSC; Category: Capacitors - MLCC; Supplier Part Number 1: C1525; Manufacturer Part Number: CL05B104KO5NNNC; Tolerance: ±10%; Voltage Rating: 16V; Temperature Coefficient: X7R; RoHS: Yes; ComponentLink1Description: Datasheet; ComponentLink1URL: https://wmsc.lcsc.com/wmsc/upload/file/pdf/v2/lcsc/2304140030_Samsung-Electro-Mechanics-CL05B104KO5NNNC_C1525.pdf; ComponentLink2Description: JLCPCB Part URL; ComponentLink2URL: https://jlcpcb.com/partdetail/C1525; ComponentLink3Description: LCSC Part URL; ComponentLink3URL: https://lcsc.com/product-detail/Multilayer-Ceramic-Capacitors-MLCC---SMD-SMT_Samsung-Electro-Mechanics-Samsung-Electro-Mechanics-CL05B104KO5NNNC_C1525.html; ComponentLink4Description: Samsung Component Library; ComponentLink4URL: https://weblib.samsungsem.com/mlcc/mlcc-ec.do?partNumber=CL05B104KO5NNN
F1 = MF-MSMF050-2: Polymeric PTC Resettable Fuse 15V 500 mA Ih Surface Mount 1812 (4532 Metric), Concave; MF: Bourns; MP: MF-MSMF050-2; Availability: In Stock; Check_prices: https://www.snapeda.com/parts/MF-MSMF050-2/Bourns+-+J.W.+Miller/view-part/?ref=eda; Price: None; Package: 1812 Bourns; Purchase-URL: https://pricing.snapeda.com/search/part/MF-MSMF050-2/?ref=eda; Value: *; SnapEDA_Link: https://www.snapeda.com/parts/MF-MSMF050-2/Bourns+-+J.W.+Miller/view-part/?ref=snap
FB2 = BLM15PX471SN1D: Ferrite, 470Ω@100MHz, ±25%, 200mΩ, 1A, SMD 0402; Manufacturer: Murata Electronics; Package Size: 0402; JLCPCB Basic Part: No; JLCPCB Part Number: C333978; Supplier 1: LCSC; Category: Ferrite Beads; Supplier Part Number 1: C333978; Manufacturer Part Number: BLM15PX471SN1D; Tolerance: ±25%; Rated Current: 1A; DC Resistance: 200mΩ; RoHS: Yes; ComponentLink1Description: Datasheet; ComponentLink1URL: https://wmsc.lcsc.com/wmsc/upload/file/pdf/v2/lcsc/1912111437_Murata-Electronics-BLM15PX471SN1D_C333978.pdf; ComponentLink2Description: JLCPCB Part URL; ComponentLink2URL: https://jlcpcb.com/partdetail/C333978; ComponentLink3Description: LCSC Part URL; ComponentLink3URL: https://lcsc.com/product-detail/Ferrite-Beads_Murata-Electronics-Murata-Electronics-BLM15PX471SN1D_C333978.html
J1 = TYPE-C-31-M-12: USB Connectors 24 Receptacle 1 8.94*7.3mm RoHS; MF: HRO Electronics Co., Ltd.; SnapEDA_Link: https://www.snapeda.com/parts/TYPE-C-31-M-12/HRO+Electronics+Co.%252C+Ltd./view-part/?ref=snap; Package: Package; Value: *; MP: TYPE-C-31-M-12; Check_prices: https://www.snapeda.com/parts/TYPE-C-31-M-12/HRO+Electronics+Co.%252C+Ltd./view-part/?ref=eda
J2 J5 J8 = 61300611121: Header, 6 pins, 2.54mm; MF: {'manufacturer': u'Wurth Electronics'}; Package: None; Price: None; Value: *; MP: 61300611121; Availability: Unavailable
J3 J4 = 61300311121: Header, 3 pins, 2.54mm; Package: None; Price: None; Value: *; MP: 61300311121; Availability: Unavailable
J6 J7 = 61301621121: Header, 2x8 pins, 2.54mm; MF: {'manufacturer': u'W\xfcrth Elektronik'}; Package: None; Price: None; Value: *; MP: 61301621121; Availability: Unavailable
R9 R10 = 0402WGF5101TCE: Resistor, 5.1kΩ, ±1%, 62.5mW, 50V, ±100ppm/℃, -55℃~+155℃, SMD 0402; Manufacturer: Uniroyal; Supplier 1: LCSC; Manufacturer Part Number: 0402WGF5101TCE; Supplier Part Number 1: C25905; JLCPCB Part Number: C25905; Power Rating: 62.5mW; Category: Resistors; Package Size: 0402; JLCPCB Basic Part: Yes; Tolerance: ±1%; Voltage Rating: 50V; Temperature Coefficient: ±100ppm/℃; Temperature Rating: -55℃~+155℃; ComponentLink1Description: Datasheet; ComponentLink1URL: https://wmsc.lcsc.com/wmsc/upload/file/pdf/v2/lcsc/2206010045_UNI-ROYAL-Uniroyal-Elec-0402WGF5101TCE_C25905.pdf; ComponentLink2Description: JLCPCB Part URL; ComponentLink2URL: https://jlcpcb.com/partdetail/C25905
R14 = 0402WGF1200TCE: Resistor, 120Ω, ±1%, 62.5mW, 50V, ±100ppm/℃, -55℃~+155℃, SMD 0402; Manufacturer: Uniroyal; Supplier 1: LCSC; Manufacturer Part Number: 0402WGF1200TCE; Supplier Part Number 1: C25079; JLCPCB Part Number: C25079; Power Rating: 62.5mW; Category: Resistors; Package Size: 0402; JLCPCB Basic Part: Yes; Tolerance: ±1%; Voltage Rating: 50V; Temperature Coefficient: ±100ppm/℃; Temperature Rating: -55℃~+155℃; ComponentLink1Description: Datasheet; ComponentLink1URL: https://wmsc.lcsc.com/wmsc/upload/file/pdf/v2/lcsc/2205311900_UNI-ROYAL-Uniroyal-Elec-0402WGF1200TCE_C25079.pdf; ComponentLink2Description: JLCPCB Part URL; ComponentLink2URL: https://jlcpcb.com/partdetail/C25079
U3 = USBLC6-2SC6: 17V Clamp 5A (8/20Âµs) Ipp Tvs Diode Surface Mount SOT-23-6; MF: STMicroelectronics; Value: *; SnapEDA_Link: https://www.snapeda.com/parts/USBLC6-2SC6/STMicroelectronics/view-part/?ref=snap; Check_prices: https://www.snapeda.com/parts/USBLC6-2SC6/STMicroelectronics/view-part/?ref=eda; Purchase-URL: https://pricing.snapeda.com/search/part/USBLC6-2SC6/?ref=eda; Price: None; Availability: In Stock; Package: SOT-23-6 STMicroelectronics; MP: USBLC6-2SC6

## Sheet IMU.SchDoc
size A4; SheetNumber: 4; SheetTotal: 6
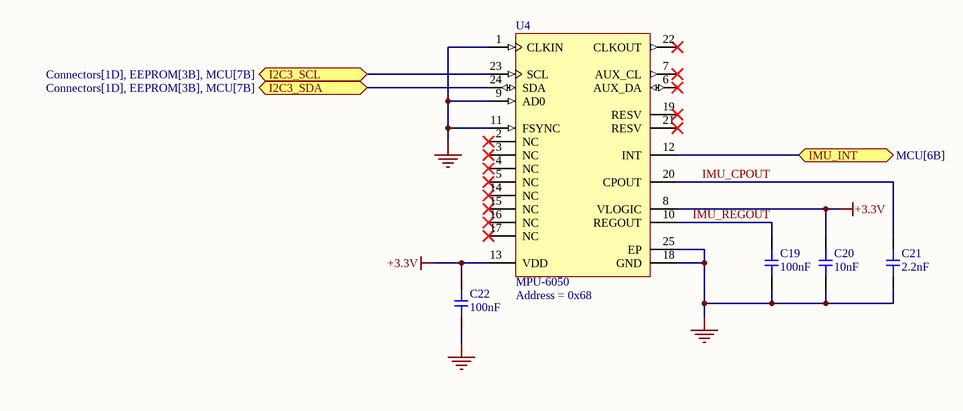
[diagram p3: IMU.SchDoc]

### Parts
C19  Capacitance: 100nF  [CAP-0402]  (hidden comment: CL05B104KO5NNNC)
C20  Capacitance: 10nF  [CAP-0402]  (hidden comment: CL05B103KB5NNNC)
C21  Capacitance: 2.2nF  [CAP-0603]  (hidden comment: 0603B222K500NT)
C22  Capacitance: 100nF  [CAP-0402]  (hidden comment: CL05B104KO5NNNC)
U4  MPU-6050  [IS-QFN-24_V]

### Ports
I2C3_SCL (bidir, see Connectors[1D], EEPROM[3B], MCU[7B]), I2C3_SDA (bidir, see Connectors[1D], EEPROM[3B], MCU[7B]), IMU_INT (bidir, see MCU[6B])

### Nets
+3.3V: C20.2 C22.2 U4.8(VLOGIC) U4.13(VDD)
GND: C19.1 C20.1 C21.1 C22.1 U4.1(CLKIN) U4.9(AD0) U4.11(FSYNC) U4.18(GND) U4.25(EP)
I2C3_SCL: U4.23(SCL) ; port I2C3_SCL
I2C3_SDA: U4.24(SDA) ; port I2C3_SDA
IMU_CPOUT: C21.2 U4.20(CPOUT)
IMU_INT: U4.12(INT) ; port IMU_INT
IMU_REGOUT: C19.2 U4.10(REGOUT)

Not connected (* = marked no-connect by the designer): U4 2(NC)* 3(NC)* 4(NC)* 5(NC)* 6(AUX_DA)* 7(AUX_CL)* 14(NC)* 15(NC)* 16(NC)* 17(NC)* 19(RESV)* 21(RESV)* 22(CLKOUT)*

### Notes on the sheet
- (near U4) Address = 0x68

### Library data of the parts
C19 C22 = CL05B104KO5NNNC: as C2 on sheet MCU; Package Size: 0402; JLCPCB Basic Part: Yes; JLCPCB Part Number: C1525; Supplier 1: LCSC; Category: Capacitors - MLCC; Supplier Part Number 1: C1525; Manufacturer Part Number: CL05B104KO5NNNC; Tolerance: ±10%; Voltage Rating: 16V; Temperature Coefficient: X7R; RoHS: Yes; ComponentLink1Description: Datasheet; ComponentLink1URL: https://wmsc.lcsc.com/wmsc/upload/file/pdf/v2/lcsc/2304140030_Samsung-Electro-Mechanics-CL05B104KO5NNNC_C1525.pdf; ComponentLink2Description: JLCPCB Part URL; ComponentLink2URL: https://jlcpcb.com/partdetail/C1525; ComponentLink3Description: LCSC Part URL; ComponentLink3URL: https://lcsc.com/product-detail/Multilayer-Ceramic-Capacitors-MLCC---SMD-SMT_Samsung-Electro-Mechanics-Samsung-Electro-Mechanics-CL05B104KO5NNNC_C1525.html; ComponentLink4Description: Samsung Component Library; ComponentLink4URL: https://weblib.samsungsem.com/mlcc/mlcc-ec.do?partNumber=CL05B104KO5NNN
C20 = CL05B103KB5NNNC: as C9 on sheet MCU; Package Size: 0402; JLCPCB Basic Part: Yes; JLCPCB Part Number: C15195; Supplier 1: LCSC; Category: Capacitors - MLCC; Supplier Part Number 1: C15195; Manufacturer Part Number: CL05B103KB5NNNC; Tolerance: ±10%; Voltage Rating: 50V; Temperature Coefficient: X7R; RoHS: Yes; ComponentLink1Description: Datasheet; ComponentLink1URL: https://wmsc.lcsc.com/wmsc/upload/file/pdf/v2/lcsc/2304140030_Samsung-Electro-Mechanics-CL05B103KB5NNNC_C15195.pdf; ComponentLink2Description: JLCPCB Part URL; ComponentLink2URL: https://jlcpcb.com/partdetail/C15195; ComponentLink3Description: LCSC Part URL; ComponentLink3URL: https://lcsc.com/product-detail/Multilayer-Ceramic-Capacitors-MLCC---SMD-SMT_Samsung-Electro-Mechanics-Samsung-Electro-Mechanics-CL05B103KB5NNNC_C15195.html; ComponentLink4Description: Samsung Component Library; ComponentLink4URL: https://weblib.samsungsem.com/mlcc/mlcc-ec.do?partNumber=CL05B103KB5NNN
C21 = 0603B222K500NT: Capacitor, Ceramic (MLCC), 2.2nF, ±10%, 50V, X7R, ±10%, SMD 0603; Manufacturer: FH(Guangdong Fenghua Advanced Tech); Package Size: 0603; JLCPCB Basic Part: Yes; JLCPCB Part Number: C1604; Supplier 1: LCSC; Category: Capacitors - MLCC; Supplier Part Number 1: C1604; Manufacturer Part Number: 0603B222K500NT; Tolerance: ±10%; Voltage Rating: 50V; Temperature Coefficient: X7R; RoHS: Yes; ComponentLink1Description: Datasheet; ComponentLink1URL: https://wmsc.lcsc.com/wmsc/upload/file/pdf/v2/lcsc/2304140030_FH--Guangdong-Fenghua-Advanced-Tech-0603B222K500NT_C1604.pdf; ComponentLink2Description: JLCPCB Part URL; ComponentLink2URL: https://jlcpcb.com/partdetail/C1604; ComponentLink3Description: LCSC Part URL; ComponentLink3URL: https://lcsc.com/product-detail/Multilayer-Ceramic-Capacitors-MLCC---SMD-SMT_FH-Guangdong-Fenghua-Advanced-Tech-FH-Guangdong-Fenghua-Advanced-Tech-0603B222K500NT_C1604.html
U4 = CMP-1753-00002-2: 3-Axis Gyroscope, Accelerometer and a Digital Motion Processor(TM) (DMP), 2.375 to 3.46 V, -40 to 85 degC, 24-Pin QFN, RoHS, Tape and Reel; Manufacturer: InvenSense; Featured Product: MPU-60506-Axis,IntegratedI²CSolution; Other Names: 1428-1007-2 / MPU6050; Sensor Type: MotionTracking; Online Catalog: MPU-6000™Series; Unit PriceUSD: Digital; Datasheet Version: Rev. 3.3, 05/2012; Category: Sensors,Transducers; Datasheet URL: http://datasheet.octopart.com/MPU-6050-InvenSense-datasheet-14421344.pdf; Family: Multifunction; Standard Package: 5,000; Manufacturer URL: http://www.invensense.com/; Output Type: Digital; Dynamic Catalog: MPU-6000™Series

## Sheet CAN_Transceiver.SchDoc
size A4; SheetNumber: 5; SheetTotal: 5
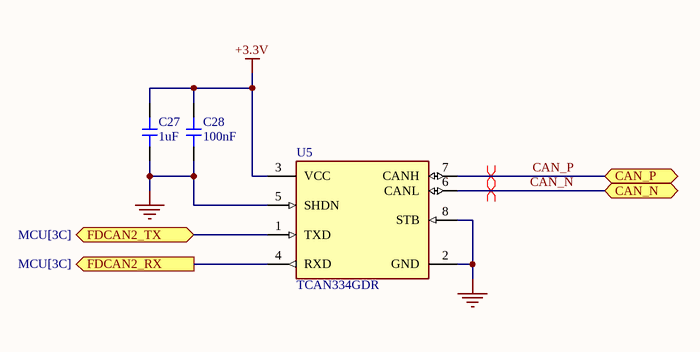
[diagram p4: CAN_Transceiver.SchDoc]

### Parts
C27  Capacitance: 1uF  [CAP-0402]  (hidden comment: CL05A105KA5NQNC)
C28  Capacitance: 100nF  [CAP-0402]  (hidden comment: CL05B104KO5NNNC)
U5  TCAN334GDR  [FP-D0008A-IPC_B]

### Ports
CAN_N (bidir), CAN_P (bidir), FDCAN2_RX (out, see MCU[3C]), FDCAN2_TX (bidir, see MCU[3C])

### Nets
+3.3V: C27.2 C28.2 U5.3(VCC)
GND: C27.1 C28.1 U5.2(GND) U5.5(SHDN) U5.8(STB)
CAN_N: U5.6(CANL) ; port CAN_N
CAN_P: U5.7(CANH) ; port CAN_P
FDCAN2_RX: U5.4(RXD) ; port FDCAN2_RX
FDCAN2_TX: U5.1(TXD) ; port FDCAN2_TX

### Layout directives
differential pair: CAN_N, CAN_P

### Library data of the parts
C27 = CL05A105KA5NQNC: as C7 on sheet MCU; Package Size: 0402; JLCPCB Basic Part: Yes; JLCPCB Part Number: C52923; Supplier 1: LCSC; Category: Capacitors - MLCC; Supplier Part Number 1: C52923; Manufacturer Part Number: CL05A105KA5NQNC; Tolerance: ±10%; Voltage Rating: 25V; Temperature Coefficient: X5R; RoHS: Yes; ComponentLink1Description: Datasheet; ComponentLink1URL: https://wmsc.lcsc.com/wmsc/upload/file/pdf/v2/lcsc/2304140030_Samsung-Electro-Mechanics-CL05A105KA5NQNC_C52923.pdf; ComponentLink2Description: JLCPCB Part URL; ComponentLink2URL: https://jlcpcb.com/partdetail/C52923; ComponentLink3Description: LCSC Part URL; ComponentLink3URL: https://lcsc.com/product-detail/Multilayer-Ceramic-Capacitors-MLCC---SMD-SMT_Samsung-Electro-Mechanics-Samsung-Electro-Mechanics-CL05A105KA5NQNC_C52923.html; ComponentLink4Description: Samsung Component Library; ComponentLink4URL: https://weblib.samsungsem.com/mlcc/mlcc-ec.do?partNumber=CL05A105KA5NQN
C28 = CL05B104KO5NNNC: as C2 on sheet MCU; Package Size: 0402; JLCPCB Basic Part: Yes; JLCPCB Part Number: C1525; Supplier 1: LCSC; Category: Capacitors - MLCC; Supplier Part Number 1: C1525; Manufacturer Part Number: CL05B104KO5NNNC; Tolerance: ±10%; Voltage Rating: 16V; Temperature Coefficient: X7R; RoHS: Yes; ComponentLink1Description: Datasheet; ComponentLink1URL: https://wmsc.lcsc.com/wmsc/upload/file/pdf/v2/lcsc/2304140030_Samsung-Electro-Mechanics-CL05B104KO5NNNC_C1525.pdf; ComponentLink2Description: JLCPCB Part URL; ComponentLink2URL: https://jlcpcb.com/partdetail/C1525; ComponentLink3Description: LCSC Part URL; ComponentLink3URL: https://lcsc.com/product-detail/Multilayer-Ceramic-Capacitors-MLCC---SMD-SMT_Samsung-Electro-Mechanics-Samsung-Electro-Mechanics-CL05B104KO5NNNC_C1525.html; ComponentLink4Description: Samsung Component Library; ComponentLink4URL: https://weblib.samsungsem.com/mlcc/mlcc-ec.do?partNumber=CL05B104KO5NNN
U5 = CMP-04872-000213-1: IC TRANSCEIVER 1/1 8SOIC; Receiver Hysteresis: 120mV; Data Rate: 1Mbps; Mount: Surface Mount; Lead Free: Lead Free; Max Operating Temperature: 125°C; Case/Package: SOIC; RoHS Compliant: Yes; Packaging: Tape and Reel; Min Operating Temperature: -40°C

## Sheet EEPROM.SchDoc
size A4; SheetNumber: 6; SheetTotal: 6
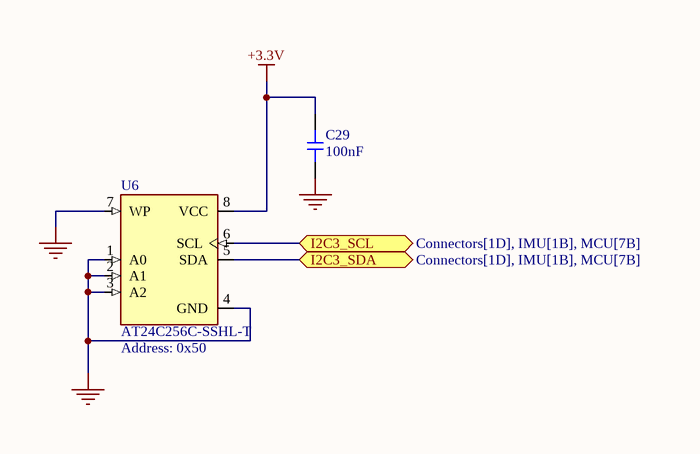
[diagram p5: EEPROM.SchDoc]

### Parts
C29  Capacitance: 100nF  [CAP-0402]  (hidden comment: CL05B104KO5NNNC)
U6  AT24C256C-SSHL-T  [SOIC127P600X175-8N]

### Ports
I2C3_SCL (bidir, see Connectors[1D], IMU[1B], MCU[7B]), I2C3_SDA (bidir, see Connectors[1D], IMU[1B], MCU[7B])

### Nets
+3.3V: C29.2 U6.8(VCC)
GND: C29.1 U6.1(A0) U6.2(A1) U6.3(A2) U6.4(GND) U6.7(WP)
I2C3_SCL: U6.6(SCL) ; port I2C3_SCL
I2C3_SDA: U6.5(SDA) ; port I2C3_SDA

### Notes on the sheet
- (near U6) Address: 0x50

### Library data of the parts
C29 = CL05B104KO5NNNC: as C2 on sheet MCU; Package Size: 0402; JLCPCB Basic Part: Yes; JLCPCB Part Number: C1525; Supplier 1: LCSC; Category: Capacitors - MLCC; Supplier Part Number 1: C1525; Manufacturer Part Number: CL05B104KO5NNNC; Tolerance: ±10%; Voltage Rating: 16V; Temperature Coefficient: X7R; RoHS: Yes; ComponentLink1Description: Datasheet; ComponentLink1URL: https://wmsc.lcsc.com/wmsc/upload/file/pdf/v2/lcsc/2304140030_Samsung-Electro-Mechanics-CL05B104KO5NNNC_C1525.pdf; ComponentLink2Description: JLCPCB Part URL; ComponentLink2URL: https://jlcpcb.com/partdetail/C1525; ComponentLink3Description: LCSC Part URL; ComponentLink3URL: https://lcsc.com/product-detail/Multilayer-Ceramic-Capacitors-MLCC---SMD-SMT_Samsung-Electro-Mechanics-Samsung-Electro-Mechanics-CL05B104KO5NNNC_C1525.html; ComponentLink4Description: Samsung Component Library; ComponentLink4URL: https://weblib.samsungsem.com/mlcc/mlcc-ec.do?partNumber=CL05B104KO5NNN
U6 = AT24C256C-SSHL-T: AT24C256C Series 256 Kb (32 K x 8) 1.7 V I2C-Compatible Serial EEPROM - SOIC-8; MF: Microchip Technology; MP: AT24C256CSSHLT; SnapEDA_Link: https://www.snapeda.com/parts/AT24C256CSSHLT/Microchip+Technology/view-part/?ref=snap; Package: None; Value: *; Check_prices: https://www.snapeda.com/parts/AT24C256CSSHLT/Microchip+Technology/view-part/?ref=eda

## Nets that join several sheets
+3.3V: MCU (19 pins), Power (C16.2 D4.2 U2.5), Connectors (J2.1 J5.2 J7.1 J8.2), IMU (C20.2 C22.2 U4.8 U4.13), CAN_Transceiver (C27.2 C28.2 U5.3), EEPROM (C29.2 U6.8)
+3.3VA: MCU (8 pins), Connectors (J6.1 J6.15)
+5V: Power (C15.2 U2.1 U2.3), Connectors (C18.2 FB2.2 J7.15)
GND: MCU (33 pins), Power (C15.1 C16.1 R8.1 U2.2), Connectors (22 pins), IMU (9 pins), CAN_Transceiver (5 pins), EEPROM (6 pins)
CAN_N: Connectors (J4.2 R14.1), CAN_Transceiver (U5.6)
CAN_P: Connectors (J4.1 R14.2), CAN_Transceiver (U5.7)
EXT_I2C_INT: MCU (U1.26), Connectors (J5.5)
FDCAN2_RX: MCU (U1.34), CAN_Transceiver (U5.4)
FDCAN2_TX: MCU (U1.35), CAN_Transceiver (U5.1)
I2C3_SCL: MCU (R12.1 U1.40), Connectors (J5.4), IMU (U4.23), EEPROM (U6.6)
I2C3_SDA: MCU (R11.1 U1.41), Connectors (J5.3), IMU (U4.24), EEPROM (U6.5)
IMU_INT: MCU (U1.39), IMU (U4.12)
JTAG_SWCLK: MCU (U1.50), Connectors (J2.2)
JTAG_SWDIO: MCU (U1.49), Connectors (J2.4)
JTAG_SWO: MCU (U1.56), Connectors (J2.6)
MCU_NRST: MCU (C12.2 R6.1 S3.3 U1.7), Connectors (J2.5)
NetJ8_3: MCU (R13.2), Connectors (J8.3)
PA0: MCU (U1.12), Connectors (J6.6)
PA1: MCU (U1.13), Connectors (J6.7)
PA2: MCU (U1.14), Connectors (J6.8)
PA3: MCU (U1.17), Connectors (J6.9)
PA4: MCU (U1.18), Connectors (J6.10)
PA5: MCU (U1.19), Connectors (J6.11)
PA6: MCU (U1.20), Connectors (J6.12)
PA7: MCU (U1.21), Connectors (J6.13)
PA8: MCU (U1.42), Connectors (J7.8)
PA9: MCU (U1.43), Connectors (J7.10)
PA10: MCU (U1.44), Connectors (J7.12)
PA15: MCU (U1.51), Connectors (J5.6)
PB0: MCU (U1.24), Connectors (J7.4)
PB1: MCU (U1.25), Connectors (J7.6)
PB4: MCU (U1.57), Connectors (J7.11)
PB5: MCU (U1.58), Connectors (J7.9)
PB6: MCU (U1.59), Connectors (J7.7)
PB7: MCU (U1.60), Connectors (J7.5)
PC1: MCU (U1.9), Connectors (J6.3)
PC2: MCU (U1.10), Connectors (J6.4)
PC3: MCU (U1.11), Connectors (J6.5)
PC6: MCU (U1.38), Connectors (J7.13)
PC13: MCU (U1.2), Connectors (J7.3)
SPI_CS: MCU (U1.55), Connectors (J8.6)
SPI_MISO: MCU (U1.53), Connectors (J8.4)
SPI_MOSI: MCU (U1.54), Connectors (J8.5)
USART1_RX: MCU (U1.23), Connectors (J3.2)
USART1_TX: MCU (U1.22), Connectors (J3.1)
USB_D_N: MCU (U1.45), Connectors (U3.6)
USB_D_P: MCU (U1.46), Connectors (U3.4)